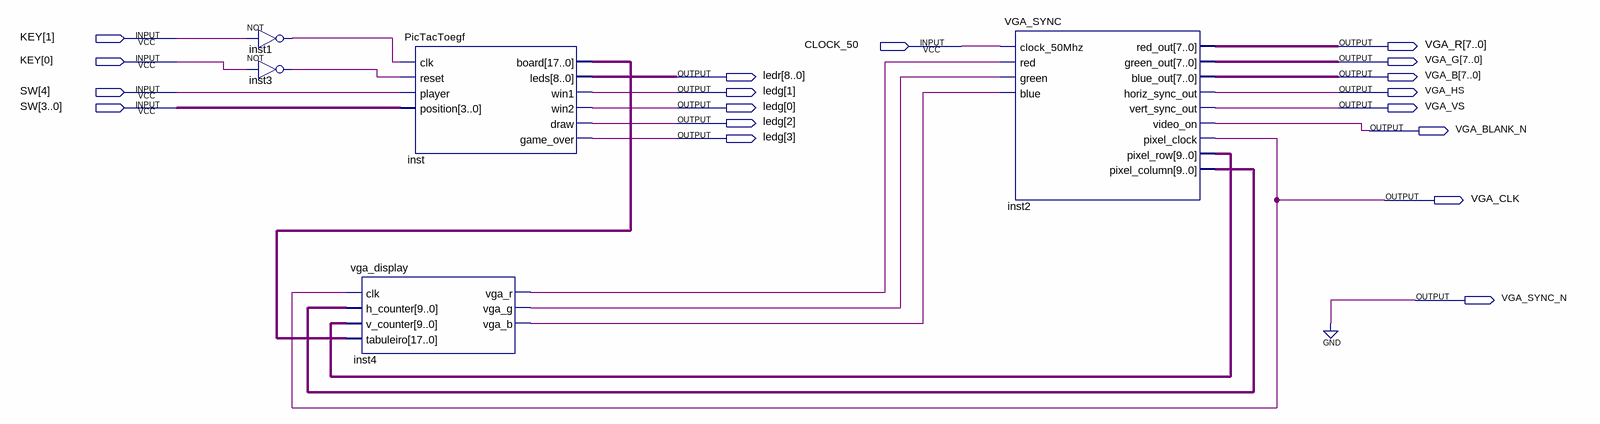
[diagram p0: schematic sheet]
// Quartus schematic Jogo_da_Velha.bdf as structural Verilog: 5 symbols, 18 pins
module Jogo_da_Velha (
  input  [1:0] KEY,
  input  CLOCK_50,
  input  [4:0] SW,
  output [7:0] VGA_R,
  output [7:0] VGA_G,
  output [8:0] ledr,
  output [7:0] VGA_B,
  output [3:0] ledg,
  output VGA_HS,
  output VGA_VS,
  output VGA_BLANK_N,
  output VGA_CLK,
  output VGA_SYNC_N
);

  wire inst1_out, inst3_out, inst4_vga_b, inst4_vga_g, inst4_vga_r;
  wire [9:0] inst2_pixel_column, inst2_pixel_row;
  wire [17:0] inst_board;

  not inst1 (inst1_out, KEY[1]);
  not inst3 (inst3_out, KEY[0]);
  vga_display inst4 (
    .clk(VGA_CLK), .h_counter(inst2_pixel_column), .v_counter(inst2_pixel_row), .tabuleiro(inst_board),
    .vga_r(inst4_vga_r), .vga_g(inst4_vga_g), .vga_b(inst4_vga_b));
  PicTacToegf inst (
    .clk(inst1_out), .reset(inst3_out), .player(SW[4]), .position(SW[3:0]), .board(inst_board), .leds(ledr),
    .win1(ledg[1]), .win2(ledg[0]), .draw(ledg[2]), .game_over(ledg[3]));
  VGA_SYNC inst2 (
    .clock_50Mhz(CLOCK_50), .red(inst4_vga_r), .green(inst4_vga_g), .blue(inst4_vga_b), .red_out(VGA_R),
    .green_out(VGA_G), .blue_out(VGA_B), .horiz_sync_out(VGA_HS), .vert_sync_out(VGA_VS),
    .video_on(VGA_BLANK_N), .pixel_clock(VGA_CLK), .pixel_row(inst2_pixel_row),
    .pixel_column(inst2_pixel_column));

  assign VGA_SYNC_N = 1'b0;
endmodule
